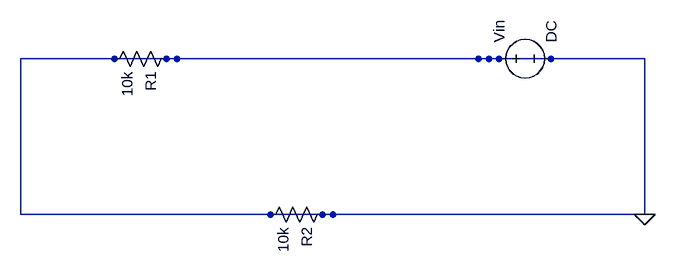
[diagram p0: schematic netlist1.asc]
netlist1.asc, the LTspice schematic file:
Version 4
SHEET 1 680 480
SYMBOL voltage 960 240 R270
SYMATTR InstName Vin
SYMATTR Value DC
FLAG 1200 480 0
SYMBOL res 480 224 R90
SYMATTR InstName R1
SYMATTR Value 10k
SYMBOL res 720 464 R90
SYMATTR InstName R2
SYMATTR Value 10k
WIRE 720 240 960 240
WIRE 464 240 720 240
WIRE 240 240 480 240
WIRE 704 480 1200 480
WIRE 1200 240 944 240
WIRE 1200 240 1200 480
WIRE 240 480 240 240
WIRE 240 480 720 480

The netlist it stands for:
* netlist1.asc
Vin 0 0 DC
R1 0 0 10k
R2 0 0 10k
.backanno
.end